# EAGLE design Main Board v.2 (EAGLE 9.6.2)
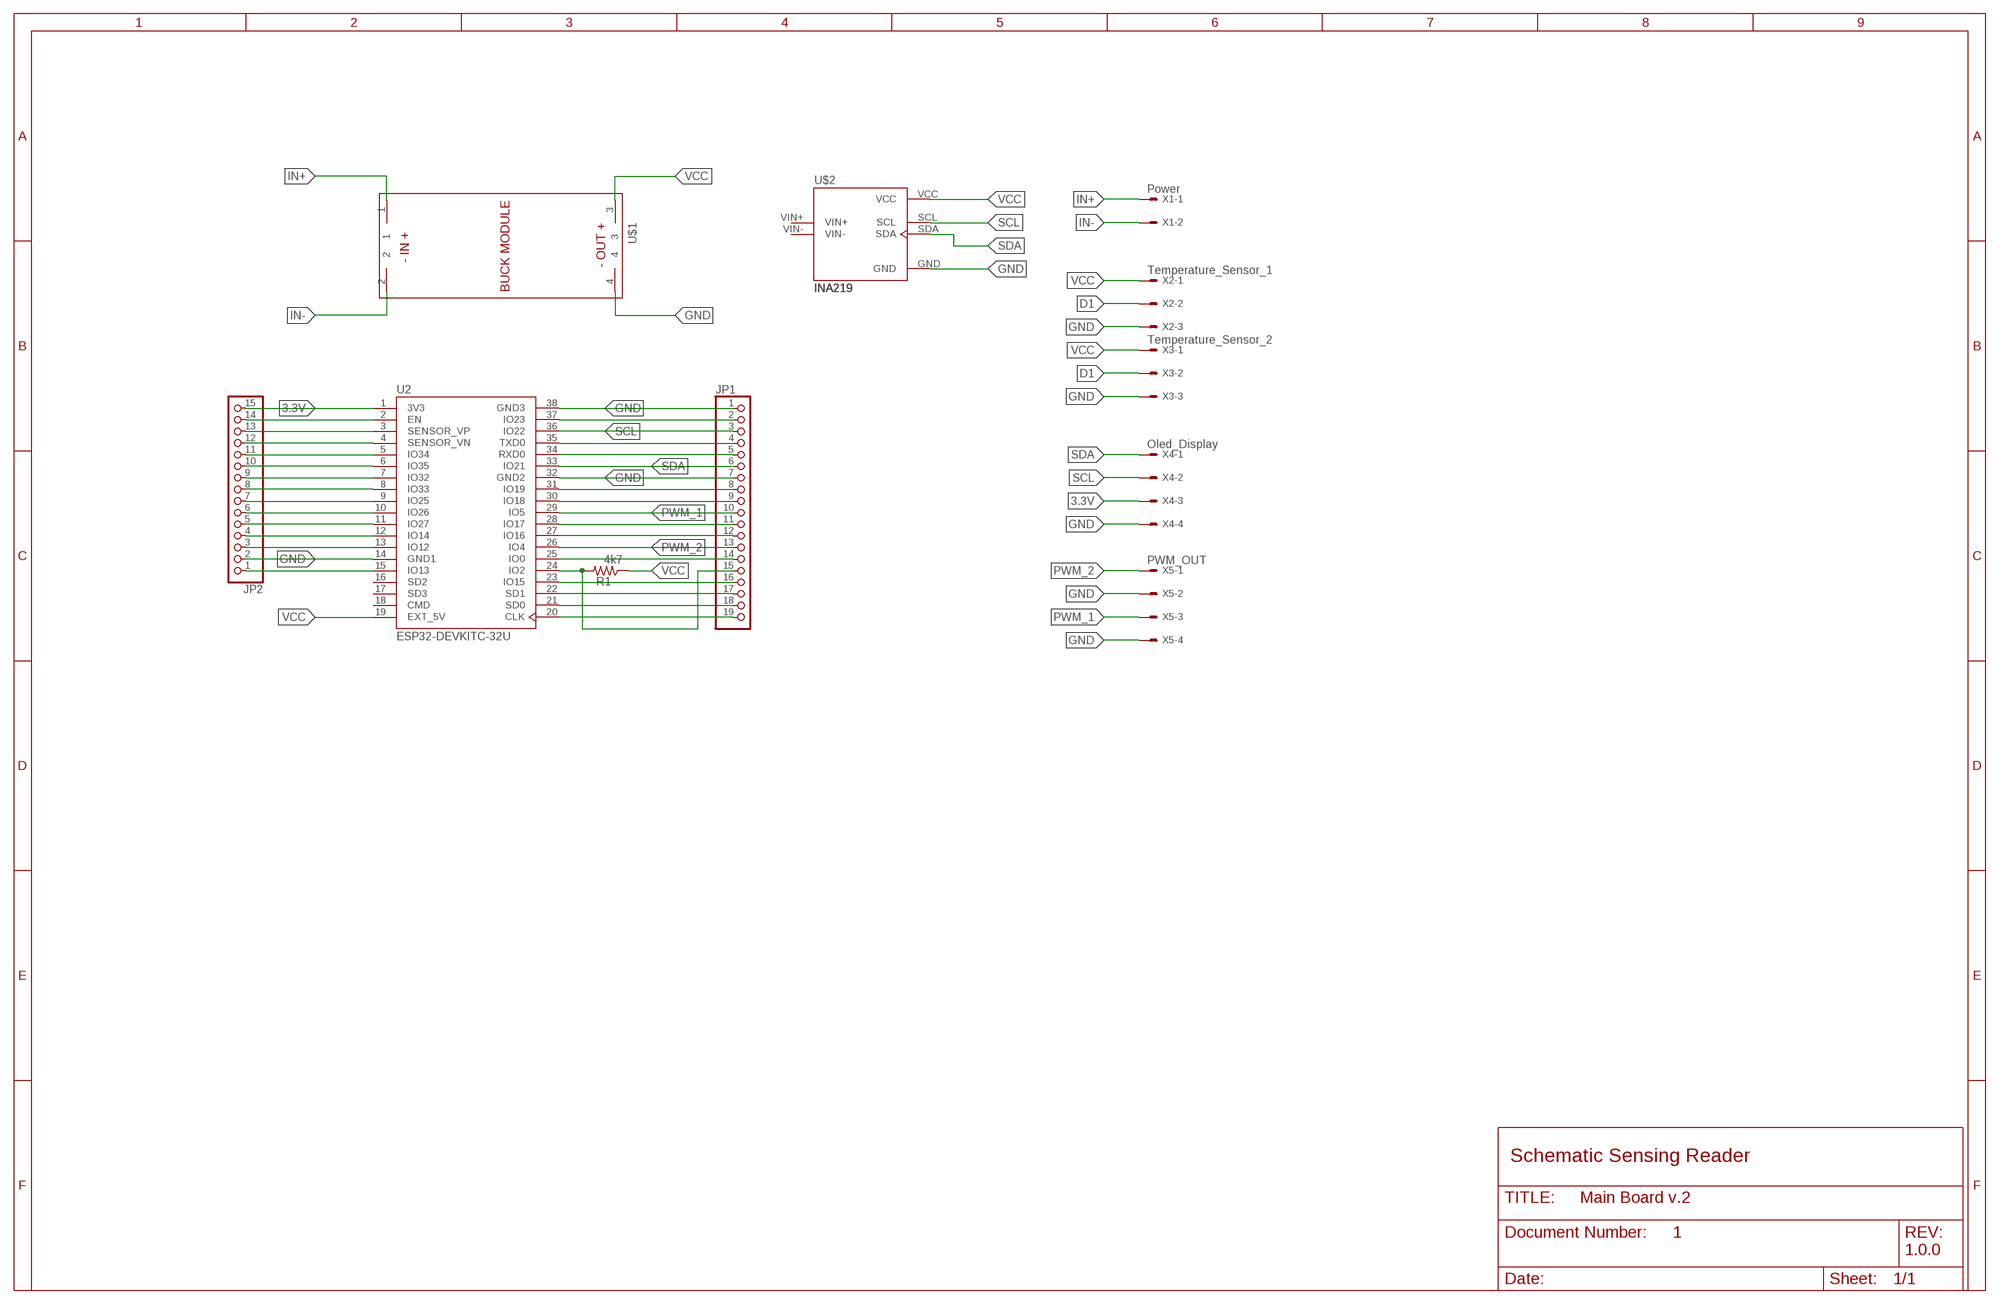
[diagram p0: schematic, sheet 1]
FRAME1 (FRAME_B_L): DESIGNER: PRATIK MAKWANA; DOC: 1; REV: 1.0.0

## Parts
JP1  PINHD-1X19  [1X19]
JP2  PINHD-1X15  [1X15]
R1  4k7  R-US_0207/10  [0207/10]
U2  ESP32-DEVKITC-32U  [MODULE_ESP32-DEVKITC-32U]
U$1  BUCK_MODULEWITH_SMDPADS&THROUGHHOLES  [BUCK_MODULE]
U$2  INA219  [INA219]
X1  Power  22-23-2021  [22-23-2021]
X2  Temperature_Sensor_1  22-23-2031  [22-23-2031]
X3  Temperature_Sensor_2  22-23-2031  [22-23-2031]
X4  Oled_Display  22-23-2041  [22-23-2041]
X5  PWM_OUT  22-23-2041  [22-23-2041]

## Nets
3.3V: JP2.15 U2.1(3V3) X4.3
D1: JP1.15 R1.2 U2.24(IO2) X2.2 X3.2
GND: JP1.1 JP1.7 JP2.2 U2.14(GND1) U2.32(GND2) U2.38(GND3) U$1.4 U$2.GND X2.3 X3.3 X4.4 X5.2 X5.4
IN+: U$1.1 X1.1
IN-: U$1.2 X1.2
N$2: JP2.14 U2.2(EN)
N$3: JP2.13 U2.3(SENSOR_VP)
N$4: JP2.12 U2.4(SENSOR_VN)
N$5: JP2.11 U2.5(IO34)
N$6: JP2.10 U2.6(IO35)
N$7: JP2.9 U2.7(IO32)
N$8: JP2.8 U2.8(IO33)
N$9: JP2.7 U2.9(IO25)
N$10: JP2.6 U2.10(IO26)
N$11: JP2.5 U2.11(IO27)
N$12: JP2.4 U2.12(IO14)
N$13: JP2.3 U2.13(IO12)
N$14: JP2.1 U2.15(IO13)
N$18: JP1.19 U2.20(CLK)
N$19: JP1.18 U2.21(SD0)
N$20: JP1.17 U2.22(SD1)
N$21: JP1.14 U2.25(IO0)
N$22: JP1.16 U2.23(IO15)
N$23: JP1.12 U2.27(IO16)
N$24: JP1.11 U2.28(IO17)
N$25: JP1.9 U2.30(IO18)
N$26: JP1.2 U2.37(IO23)
N$27: JP1.4 U2.35(TXD0)
N$28: JP1.5 U2.34(RXD0)
N$29: JP1.8 U2.31(IO19)
PWM_1: JP1.10 U2.29(IO5) X5.3
PWM_2: JP1.13 U2.26(IO4) X5.1
SCL: JP1.3 U2.36(IO22) U$2.SCL X4.2
SDA: JP1.6 U2.33(IO21) U$2.SDA X4.1
VCC: R1.1 U2.19(EXT_5V) U$1.3 U$2.VCC X2.1 X3.1
Unconnected: U2.16(SD2) U2.17(SD3) U2.18(CMD) U$2.VIN+ U$2.VIN-

## Notes on the sheet
- Schematic Sensing Reader

## Library data of the parts
JP1 = pinhead:PINHD-1X19: PIN HEADER
JP2 = pinhead:PINHD-1X15: PIN HEADER
R1 = adafruit:R-US_: RESISTOR, American symbol
U2 = ESP32-DEVKITC-32U:ESP32-DEVKITC-32U: Check availability <https://pricing.snapeda.com/parts/ESP32-DEVKITC-32U/Espressif%20Systems/view-part?ref=eda>; AVAILABILITY: In Stock; CHECK_PRICES: https://www.snapeda.com/parts/ESP32-DEVKITC-32U/Espressif+Systems/view-part/?ref=eda; DESCRIPTION: ESP32-WROOM-32UE series Transceiver; 802.11 b/g/n (Wi-Fi, WiFi, WLAN), Bluetooth® Smart Ready 4.x Dual Mode Evaluation Board; MF: Espressif Systems; MP: ESP32-DEVKITC-32U; PACKAGE: CUSTOM-38 ESPRESSIF; PRICE: None; SNAPEDA_LINK: https://www.snapeda.com/parts/ESP32-DEVKITC-32U/Espressif+Systems/view-part/?ref=snap
U$1 = BUCK_MODULE:BUCK_MODULE
U$2 = INA219:INA219
X1 = con-molex:22-23-2021: .100" (2.54mm) Center Header - 2 Pin; MF: MOLEX; MPN: 22-23-2021; OC_FARNELL: 1462926; OC_NEWARK: 25C3832
X2 X3 = con-molex:22-23-2031: .100" (2.54mm) Center Header - 3 Pin; MF: MOLEX; MPN: 22-23-2031; OC_FARNELL: 1462950; OC_NEWARK: 30C0862
X4 X5 = con-molex:22-23-2041: .100" (2.54mm) Center Header - 4 Pin; MF: MOLEX; MPN: 22-23-2041; OC_FARNELL: 1462920; OC_NEWARK: 38C0355

## Board
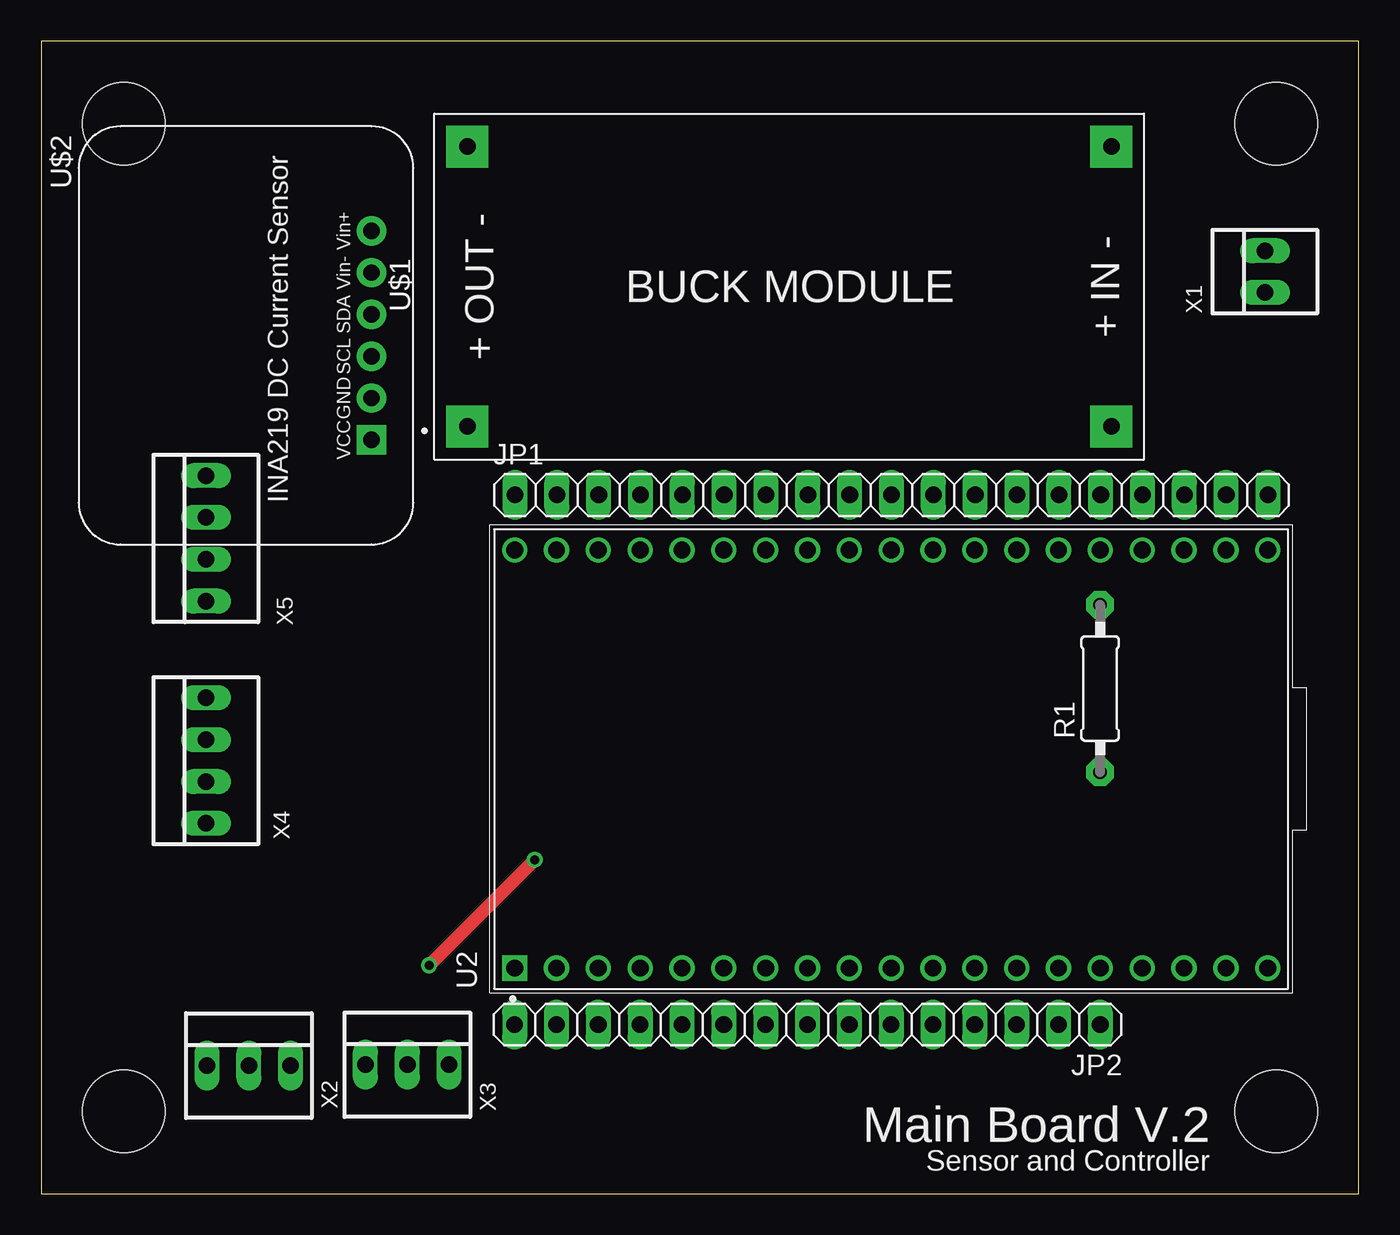
[diagram p1: board, top side]
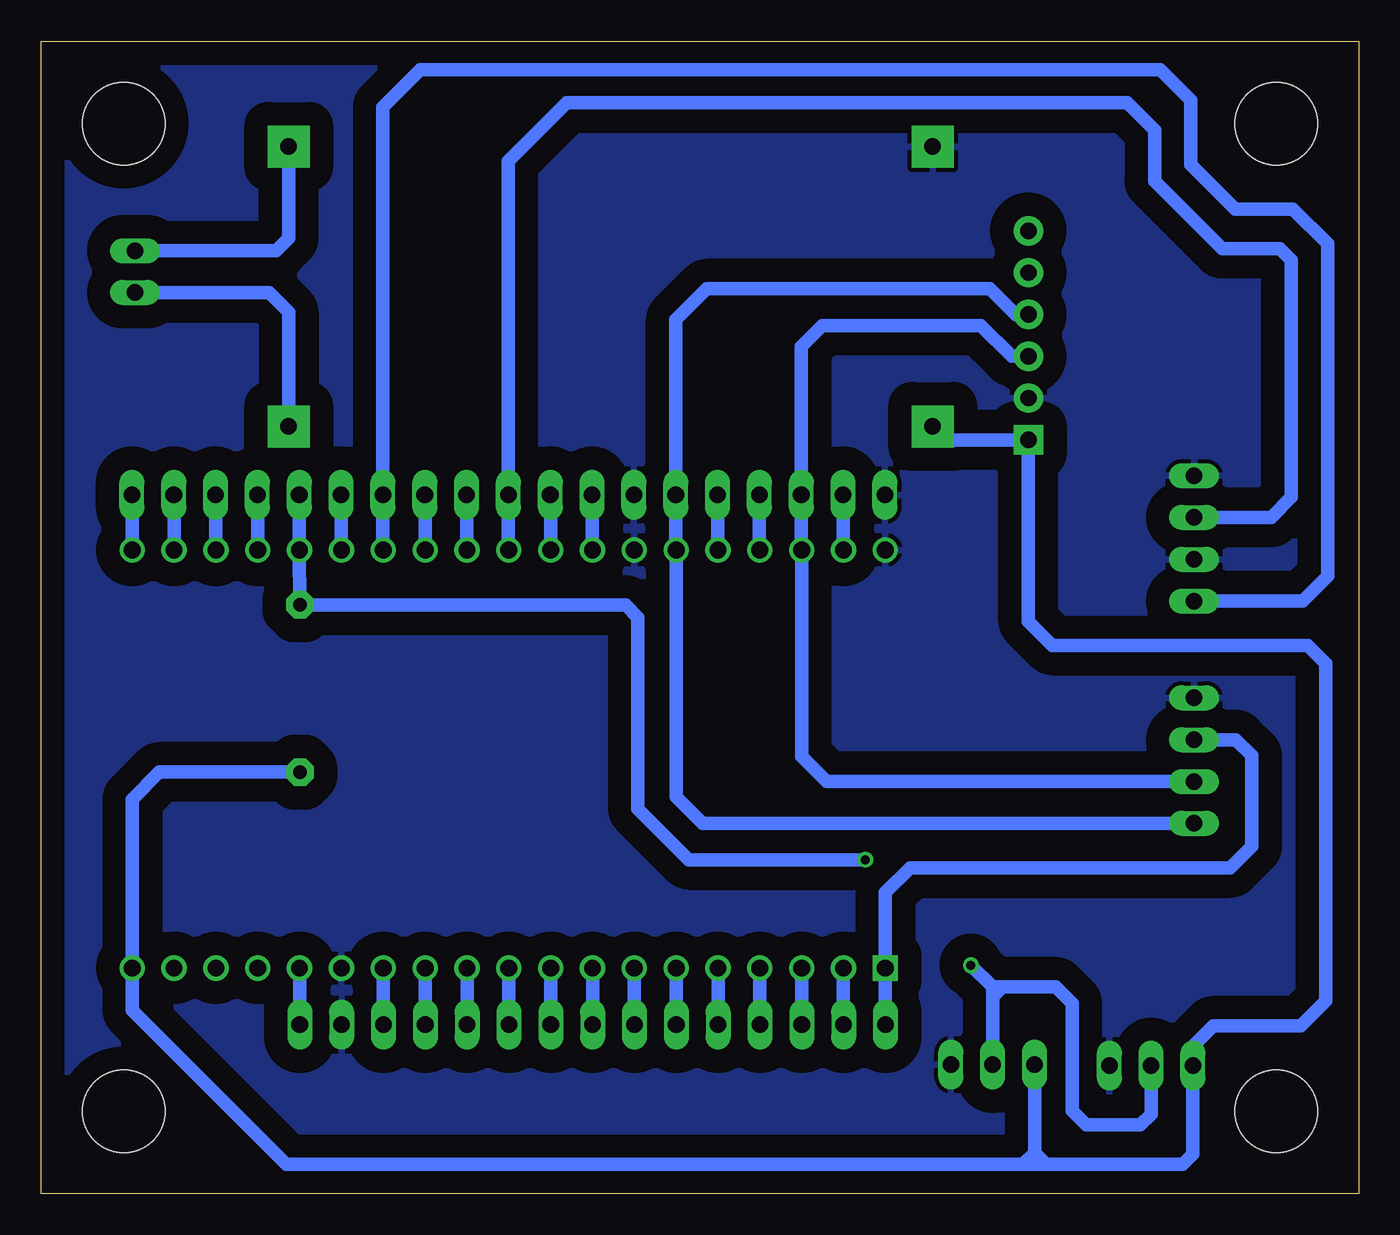
[diagram p2: board, bottom side, seen from below]

Size 80 x 70 mm. Coordinates in mm from the lower left corner, seen from the top.
Outline: 0,0 80,0 80,70 0,70 0,0
Copper layers (1*16): Top 0.035mm / dielectric 1.5mm / Bottom 0.035mm
Design rules "default": minimum track width 6mil, minimum drill 0.35mm, track to track 6mil, track to pad 6mil, pad to pad 6mil, via to via 6mil, smd to smd 6mil, copper to edge 40mil, drill to drill 6mil, minimum pad ring 10mil, minimum via ring 8mil, stop-mask expansion 4mil, vias tented up to drill 0mil, thermal gap 10mil
Holes 5 mm at 5,65 5,5 75,5 75,65

### Footprints (pad centres in the part's own frame; a part is rotated, then mirrored left to right if it is on the bottom)
1X19 = drill 1.016 long: 1 -22.86,0; 2 -20.32,0; 3 -17.78,0; 4 -15.24,0; 5 -12.7,0; 6 -10.16,0; 7 -7.62,0; 8 -5.08,0; 9 -2.54,0; 10 0,0; 11 2.54,0; 12 5.08,0; 13 7.62,0; 14 10.16,0; 15 12.7,0; 16 15.24,0; 17 17.78,0; 18 20.32,0; 19 22.86,0
1X15 = drill 1.016 long: 1 -17.78,0; 2 -15.24,0; 3 -12.7,0; 4 -10.16,0; 5 -7.62,0; 6 -5.08,0; 7 -2.54,0; 8 0,0; 9 2.54,0; 10 5.08,0; 11 7.62,0; 12 10.16,0; 13 12.7,0; 14 15.24,0; 15 17.78,0
0207/10 = drill 0.813 pad 1.676 octagon: 1 -5.08,0; 2 5.08,0
MODULE_ESP32-DEVKITC-32U = drill 1.02 square: 1 -12.7,22.85 | drill 1.02: 2 -12.7,20.31; 3 -12.7,17.77; 4 -12.7,15.23; 5 -12.7,12.69; 6 -12.7,10.15; 7 -12.7,7.61; 8 -12.7,5.07; 9 -12.7,2.53; 10 -12.7,-0.01; 11 -12.7,-2.55; 12 -12.7,-5.09; 13 -12.7,-7.63; 14 -12.7,-10.17; 15 -12.7,-12.71; 16 -12.7,-15.25; 17 -12.7,-17.79; 18 -12.7,-20.33; 19 -12.7,-22.87; 20 12.7,-22.87; 21 12.7,-20.33; 22 12.7,-17.79; 23 12.7,-15.25; 24 12.7,-12.71; 25 12.7,-10.17; 26 12.7,-7.63; 27 12.7,-5.09; 28 12.7,-2.55; 29 12.7,-0.01; 30 12.7,2.53; 31 12.7,5.07; 32 12.7,7.61; 33 12.7,10.15; 34 12.7,12.69; 35 12.7,15.23; 36 12.7,17.77; 37 12.7,20.31; 38 12.7,22.85
BUCK_MODULE = drill 1 pad 2.54 square: 1 -8.5,-19.5; 2 8.5,-19.5; 3 -8.5,19.6; 4 8.5,19.6
INA219 = drill 1 pad 1.778: GND 8.89,2.54; SCL 11.43,2.54; SDA 13.97,2.54; VIN+ 19.05,2.54; VIN- 16.51,2.54 | drill 1 pad 1.778 square: VCC 6.35,2.54
22-23-2021 = drill 1 long: 1 -1.27,0; 2 1.27,0
22-23-2031 = drill 1 long: 1 -2.54,0; 2 0,0; 3 2.54,0
22-23-2041 = drill 1 long: 1 -3.81,0; 2 -1.27,0; 3 1.27,0; 4 3.81,0

### Placement (x,y rotation side)
JP1  51.63,42.44 0 top
JP2  46.52,10.27 180 top
R1  64.29,30.68 90 top
U2  51.6,26.4 90 top
U$1  45.47,55.1 90 top
U$2  22.6,39.43 90 top
X1  74.3,56 90 top
X2  12.61,7.78 0 top
X3  22.23,7.83 0 top
X4  10,26.3 90 top
X5  10,39.8 90 top

### Tracks (layer width: path | path; a pad name or v marks a point on that pad's centre or on a via)
3.3V
  Bottom 0.813: X4.3 7.47,27.57 6.5,26.6 6.5,21.1 7.8,19.8 27.24,19.8 28.75,18.29 U2.1 JP2.15
D1  (via drill 0.55)
  Top 0.813: v29.96,20.28 v23.55,13.87
  Bottom 0.813: JP1.15 64.33,39.12 | 64.33,39.12 U2.24 | X2.2 12.61,4.82 13.26,4.17 16.55,4.17 17.41,5.03 17.41,11.56 18.4,12.55 21.62,12.55 | 22.23,12.55 22.23,11.94 | 22.23,11.94 X3.2 | 64.33,39.12 R1.2 44.51,35.74 43.77,35 43.77,23.37 40.68,20.28 v29.96,20.28 | v23.55,13.87 22.23,12.55 | 21.62,12.55 22.23,12.55 | 21.62,12.55 22.23,11.94
GND
  pour Bottom (isolate 1.422): 0.2,69.9 79.9,69.9 79.9,0 0.2,0
IN+
  Bottom 0.813: X1.1 66.16,54.73 64.97,53.54 U$1.1
IN-
  Bottom 0.813: X1.2 65.72,57.27 64.97,58.02 U$1.2
N$2
  Bottom 0.813: U2.2 JP2.14
N$3
  Bottom 0.813: JP2.13 U2.3
N$4
  Bottom 0.813: JP2.12 U2.4
N$5
  Bottom 0.813: JP2.11 U2.5
N$6
  Bottom 0.813: JP2.10 U2.6
N$7
  Bottom 0.813: U2.7 JP2.9
N$8
  Bottom 0.813: JP2.8 U2.8
N$9
  Bottom 0.813: JP2.7 U2.9
N$10
  Bottom 0.813: U2.10 JP2.6
N$11
  Bottom 0.813: JP2.5 U2.11
N$12
  Bottom 0.813: U2.12 JP2.4
N$13
  Bottom 0.813: JP2.3 U2.13
N$14
  Bottom 0.813: JP2.1 U2.15
N$18
  Bottom 0.813: U2.20 74.47,42.42 JP1.19
N$19
  Bottom 0.813: U2.21 71.93,42.42 JP1.18
N$20
  Bottom 0.813: U2.22 69.39,42.42 JP1.17
N$21
  Bottom 0.813: U2.25 61.77,42.42 JP1.14
N$22
  Bottom 0.813: U2.23 66.85,42.42 JP1.16
N$23
  Bottom 0.813: U2.27 56.69,42.42 JP1.12
N$24
  Bottom 0.813: U2.28 54.15,42.42 JP1.11
N$25
  Bottom 0.813: U2.30 49.07,42.42 JP1.9
N$26
  Bottom 0.813: U2.37 31.29,42.42 JP1.2
N$27
  Bottom 0.813: JP1.4 36.39,39.12 U2.35
N$28
  Bottom 0.813: U2.34 38.91,42.42 JP1.5
N$29
  Bottom 0.813: JP1.8 46.55,39.12 U2.31
PWM_1
  Bottom 0.813: X5.3 5.33,41.07 4.1,42.3 4.1,56.7 4.8,57.4 8.3,57.4 12.4,61.5 12.4,64.6 14.06,66.26 48.08,66.26 51.63,62.71 JP1.10 51.63,39.12 U2.29
PWM_2
  Bottom 0.813: X5.1 3.41,35.99 1.9,37.5 1.9,57.7 4,59.8 7.5,59.8 10.2,62.5 10.2,66.4 12.06,68.26 56.98,68.26 59.25,65.99 JP1.13 59.25,39.12 U2.26
SCL
  Bottom 0.813: X4.2 32.3,25.03 33.83,26.56 U2.36 33.85,39.12 JP1.3 33.85,51.45 32.58,52.72 22.94,52.72 21.08,50.86 U$2.SCL
SDA
  Bottom 0.813: X4.1 39.83,22.49 41.45,24.11 U2.33 41.47,39.12 JP1.6 41.47,53.08 39.59,54.96 22.4,54.96 20.84,53.4 U$2.SDA
VCC
  Bottom 0.813: U$1.3 25.05,45.78 U$2.VCC 20.06,34.76 18.6,33.3 3.1,33.3 2,32.2 2,11.7 3.52,10.18 8.85,10.18 10.07,8.96 X2.1 10.07,2.4 10.69,1.78 18.99,1.78 | 20.39,1.78 65.11,1.78 74.47,11.14 U2.19 74.47,23.95 72.82,25.6 R1.1 | 20.39,1.78 18.99,1.78 | X3.1 19.69,2.48 | 19.69,2.48 20.39,1.78 | 19.69,2.48 18.99,1.78

### Text on the board
tPlace: Main Board V.2 | Sensor and Controller
tValues: IN- | IN+ | GND | PWM_1 | GND | PWM_2 | GND | 3.3V | SCL | SDA | VCC | DATA | GND | VCC | DATA | GND